# EasyEDA Pro project satelitesbol.eprj, schematic satelitesbol
Board Name: satelitesbol; Create Date: 2025-08-19; Page Name: satelitesbol; Project Name: satelitesbol; Schematic Name: satelitesbol; Update Date: 2025-08-19; File: satelitesbol; Id: /; Sheet: /
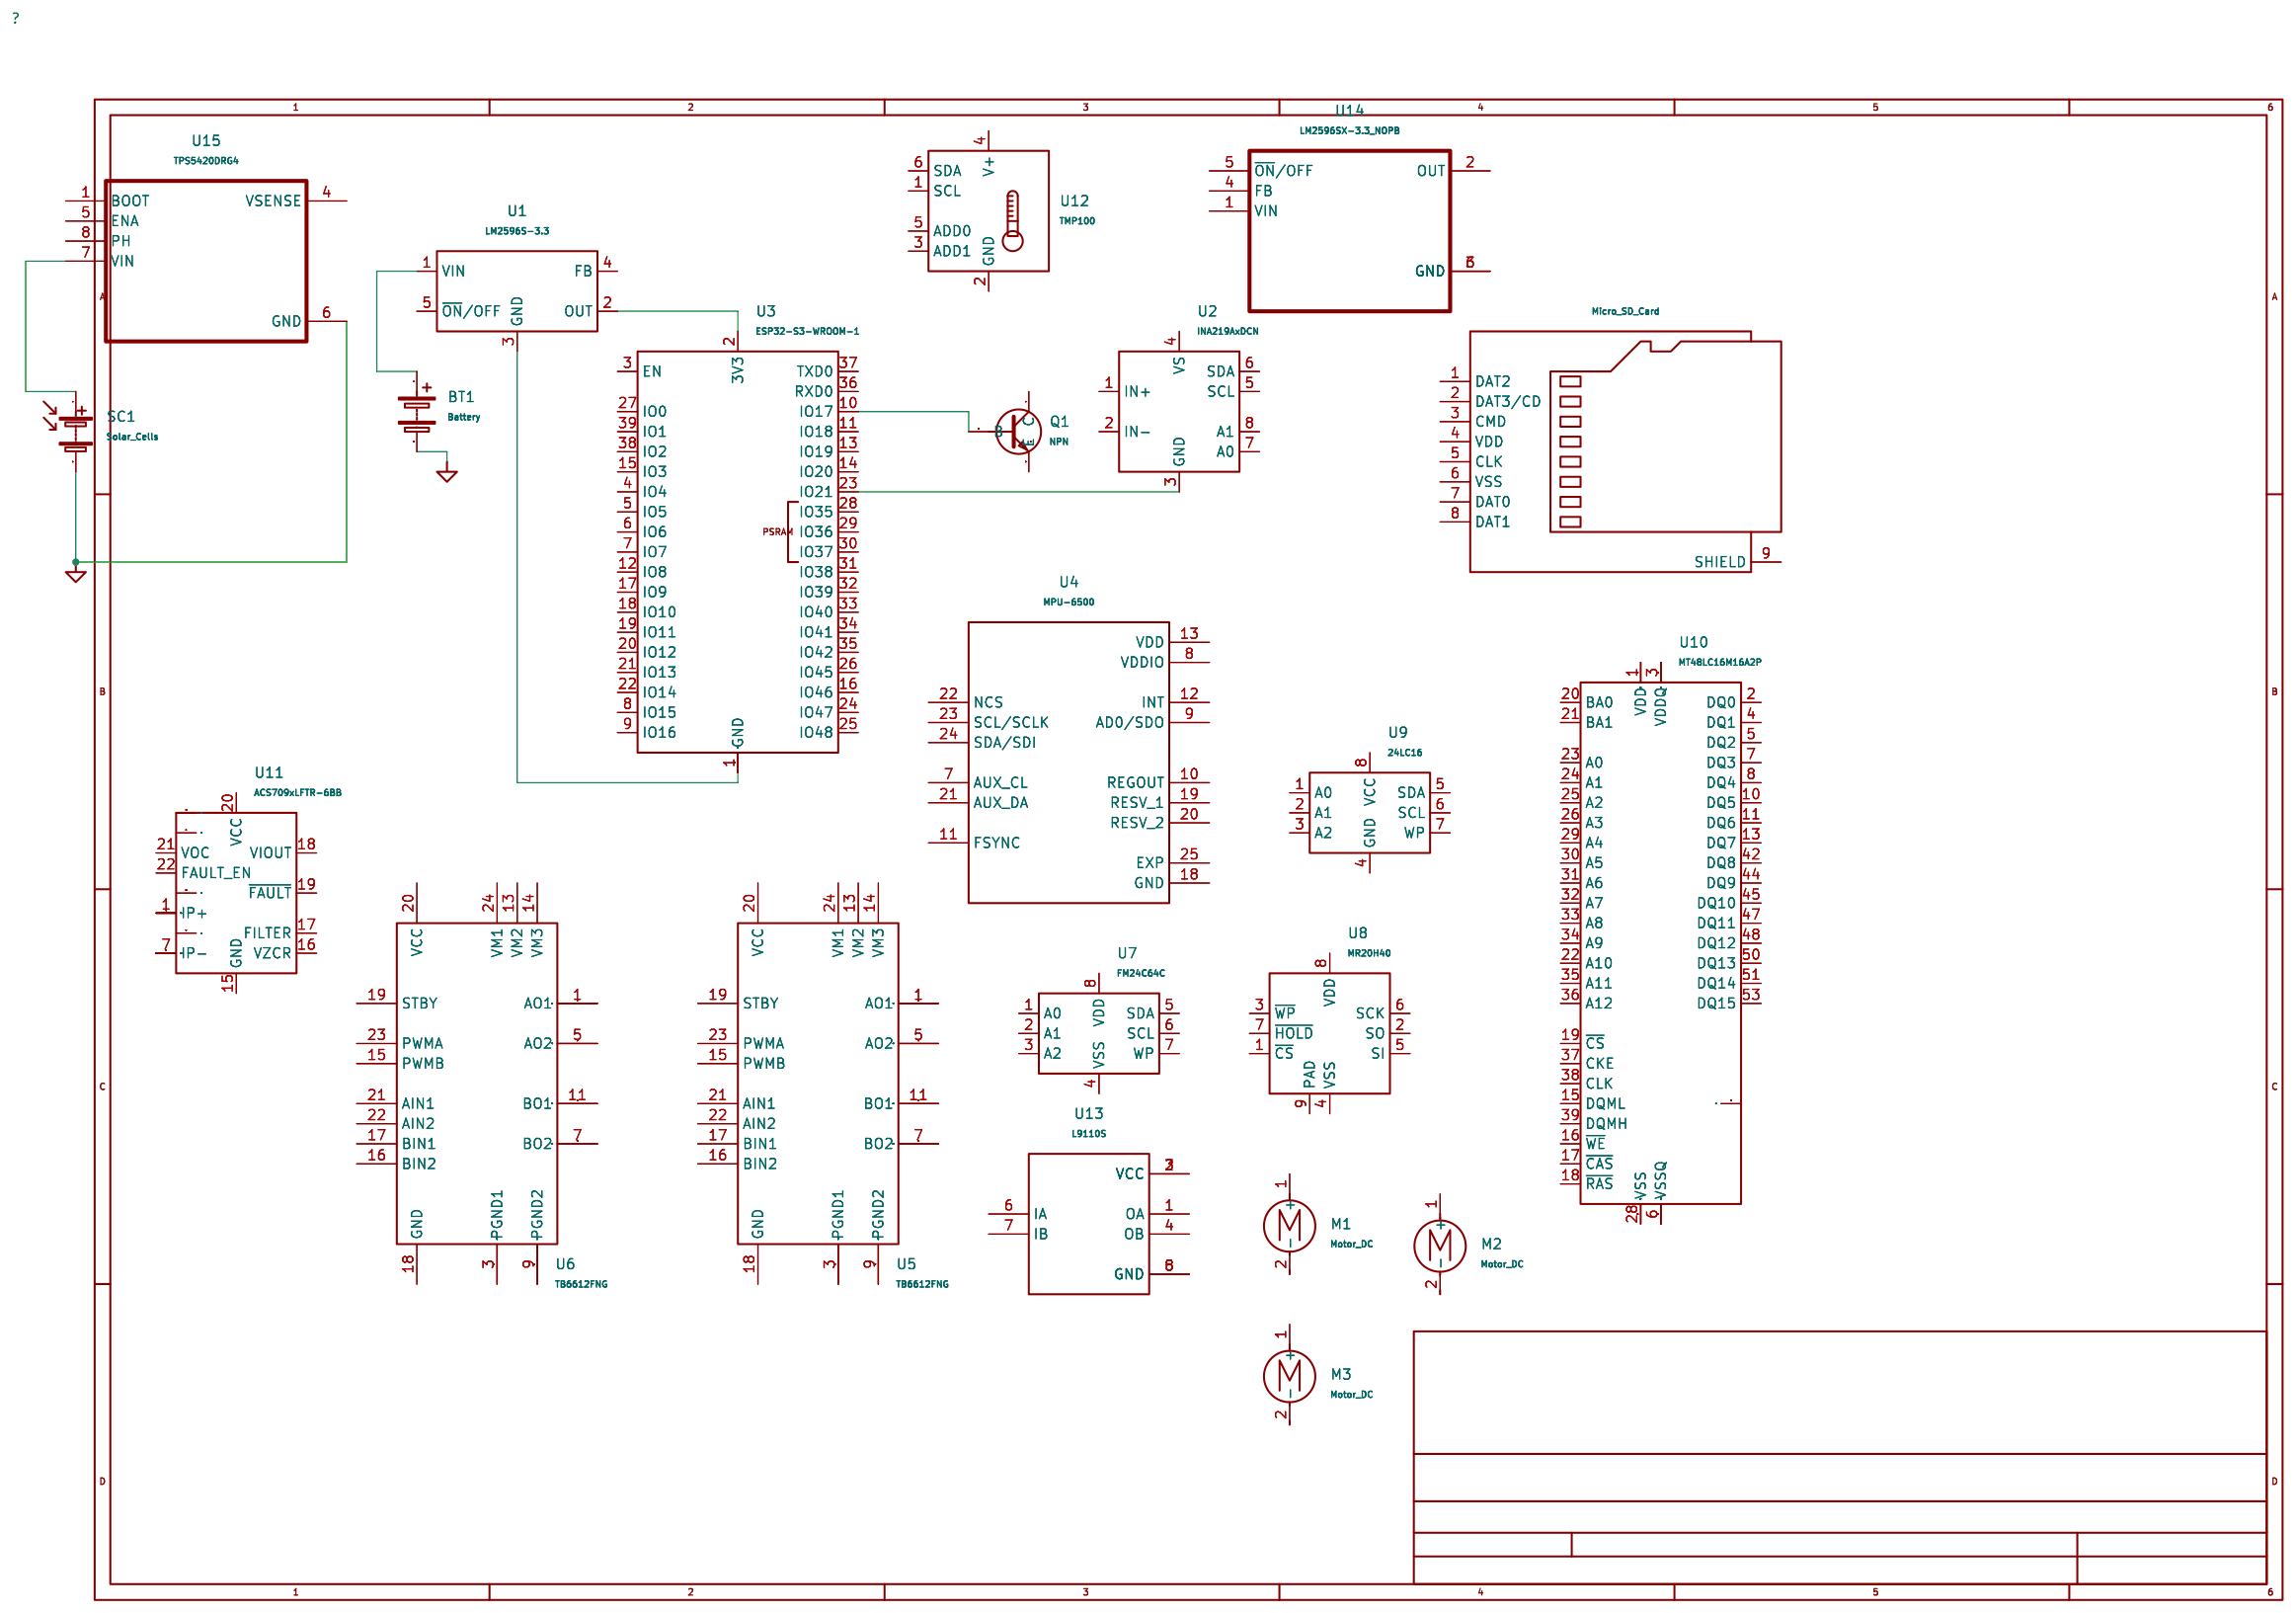
[diagram p0: schematic sheet]

## Parts
BT1  Battery
J1  Micro_SD_Card
M1  Motor_DC
M2  Motor_DC
M3  Motor_DC
Q1  NPN
SC1  Solar_Cells
U1  LM2596S-3.3
U2  INA219AxDCN
U3  ESP32-S3-WROOM-1
U4  MPU-6500
U5  TB6612FNG
U6  TB6612FNG
U7  FM24C64C
U8  MR20H40
U9  24LC16
U10  MT48LC16M16A2P
U11  ACS709xLFTR-6BB
U12  TMP100
U13  L9110S
U14  LM2596SX-3.3_NOPB
U15  TPS5420DRG4

## Library data of the parts
BT1 = Device_Battery: Multiple-cell battery
J1 = Connector_Micro_SD_Card: Micro SD Card Socket; User doc link: https://www.we-online.com/components/products/datasheet/693072010801.pdf
M1-M3 = Motor_Motor_DC: DC Motor
Q1 = Simulation_SPICE_NPN: Bipolar transistor symbol for simulation only, substrate tied to the emitter; User doc link: https://ngspice.sourceforge.io/docs/ngspice-html-manual/manual.xhtml#cha_BJTs; Sim_Type: GUMMELPOON; Sim_Pins: 1=C 2=B 3=E; Sim.Type: GUMMELPOON; Sim.Pins: 1=C 2=B 3=E
SC1 = Device_Solar_Cells: Multiple solar cells
U1 = Regulator_Switching_LM2596S-3.3: 3.3V 3A Step-Down Voltage Regulator, TO-263; User doc link: http://www.ti.com/lit/ds/symlink/lm2596.pdf
U2 = Sensor_Energy_INA219AxDCN: Zero-Drift, Bidirectional Current/Power Monitor (0-26V) With I2C Interface, SOT-23-8; User doc link: http://www.ti.com/lit/ds/symlink/ina219.pdf
U3 = RF_Module_ESP32-S3-WROOM-1: RF Module, ESP32-S3 SoC, Wi-Fi 802.11b/g/n, Bluetooth, BLE, 32-bit, 3.3V, onboard antenna, SMD; User doc link: https://www.espressif.com/sites/default/files/documentation/esp32-s3-wroom-1_wroom-1u_datasheet_en.pdf
U4 = MPU-6500_MPU-6500: B_NOM: 0.2; PIN_COUNT_D: 6.0; Check_prices: https://www.snapeda.com/parts/MPU-6500/TDK/view-part/?ref=eda; B_MAX: 0.25; Description_1: \n                        \n                            MotionTracking Device Digital Output 1.8V 24-Pin QFN EP T/R\n                        \n; Price: None; ENOM: 0.4; D_NOM: 3.0; D_MAX: 3.1; L_MAX: 0.25; Package1: QFN-24 TDK; E2_NOM: 1.54; D2_NOM: 1.7; PARTREV: 1.3; SnapEDA_Link: https://www.snapeda.com/parts/MPU-6500/TDK/view-part/?ref=snap; E_NOM: 3.0; B_MIN: 0.15; STANDARD: IPC 7351B; L_NOM: 0.3; MANUFACTURER: TDK InvenSense; MF: TDK InvenSense; MAXIMUM_PACKAGE_HEIGHT: 0.95 mm; PIN_COUNT_E: 6.0; E_MIN: 2.9; D_MIN: 2.9; L_MIN: 0.15; Availability: In Stock; E_MAX: 3.1
U5 U6 = Driver_Motor_TB6612FNG: Driver IC for Dual DC motor, SSOP-24; User doc link: https://toshiba.semicon-storage.com/us/product/linear/motordriver/detail.TB6612FNG.html
U7 = Memory_NVRAM_FM24C64C: 64Kb serial FRAM nonvolatile Memory, SOIC-8; User doc link: http://www.cypress.com/file/41651/download
U8 = Memory_NVRAM_MR20H40: 4Mb MRAM memory with SPI interface, DFN-8; User doc link: https://www.everspin.com/file/217/download
U9 = Memory_EEPROM_24LC16: I2C Serial EEPROM, 16Kb, DIP-8/SOIC-8/TSSOP-8/DFN-8; User doc link: http://ww1.microchip.com/downloads/en/DeviceDoc/21703d.pdf
U10 = Memory_RAM_MT48LC16M16A2P: 256M – (16M x 16 bit) Synchronous DRAM (SDRAM), TSOP-II-54; User doc link: https://www.micron.com/-/media/client/global/documents/products/data-sheet/dram/256mb_sdr.pdf
U11 = Sensor_Current_ACS709xLFTR-6BB: ±15A Bidirectional, Hall-Effect Current Sensor, +3.3V to +5.0V supply, 90mV/A @ +3.3V, QSOP-24; User doc link: http://www.allegromicro.com/~/media/Files/Datasheets/ACS709-Datasheet.ashx?la=en
U12 = Sensor_Temperature_TMP100: Temperature Sensor with I2C/SMBus Interface, SOT-23-6; User doc link: http://www.ti.com/lit/gpn/tmp100
U13 = L9110S_L9110S: DigiKey_Part_Number: 4518-L9110SCT-ND; SnapEDA_Link: https://www.snapeda.com/parts/L9110S/UMW/view-part/?ref=snap; MAXIMUM_PACKAGE_HEIGHT: 1.7272mm; Package1: None; Check_prices: https://www.snapeda.com/parts/L9110S/UMW/view-part/?ref=eda; STANDARD: IPC-7351B; PARTREV: NA; MF: UMW; Description_1: \n                        \n                            Bipolar Motor Driver CMOS 8-SOP\n                        \n; MANUFACTURER: UMW
U14 = LM2596SX-3.3_NOPB_LM2596SX-3.3_NOPB: MF: Texas Instruments; Description_1: \n                        \n                            SIMPLE SWITCHER- 4.5V to 40V, 3A Low Component Count Step-Down Regulator\n                        \n; Package1: TO-263-5 Texas Instruments; Price: None; SnapEDA_Link: https://www.snapeda.com/parts/LM2596SX-3.3/NOPB/Texas+Instruments/view-part/?ref=snap; MP: LM2596SX-3.3/NOPB; Availability: In Stock; Check_prices: https://www.snapeda.com/parts/LM2596SX-3.3/NOPB/Texas+Instruments/view-part/?ref=eda
U15 = TPS5420DRG4_TPS5420DRG4: MF: Texas Instruments; Description_1: \n                        \n                            5.5V to 36V Input, 2A, 500kHz Step-Down Converter 8-SOIC -40 to 125\n                        \n; Package1: SOIC-8 Texas Instruments; Price: None; SnapEDA_Link: https://www.snapeda.com/parts/TPS5420DRG4/Texas+Instruments/view-part/?ref=snap; Availability: In Stock; Check_prices: https://www.snapeda.com/parts/TPS5420DRG4/Texas+Instruments/view-part/?ref=eda

## Nets
POWER_GND: BT1.2(-) SC1.2(-) U15.6(GND)
Net-(BT1-1): BT1.1(+) U1.1(VIN)
Net-(Q1-2): Q1.2(B) U3.10(IO17)
Net-(SC1-1): SC1.1(+) U15.7(VIN)
Net-(U1-2): U1.2(OUT) U3.2(3V3)
Net-(U1-3): U1.3(GND) U3.1(GND) U3.40(GND) U3.41(GND)
Net-(U2-3): U2.3(GND) U3.23(IO21)
Net-(U5-1): U5.1(AO1) U5.2(AO1)
Net-(U5-3): U5.3(PGND1) U5.4(PGND1)
Net-(U5-5): U5.5(AO2) U5.6(AO2)
Net-(U5-7): U5.7(BO2) U5.8(BO2)
Net-(U5-9): U5.9(PGND2) U5.10(PGND2)
Net-(U5-11): U5.11(BO1) U5.12(BO1)
Net-(U6-1): U6.1(AO1) U6.2(AO1)
Net-(U6-3): U6.3(PGND1) U6.4(PGND1)
Net-(U6-5): U6.5(AO2) U6.6(AO2)
Net-(U6-7): U6.7(BO2) U6.8(BO2)
Net-(U6-9): U6.9(PGND2) U6.10(PGND2)
Net-(U6-11): U6.11(BO1) U6.12(BO1)
Net-(U10-1): U10.1(VDD) U10.14(VDD) U10.27(VDD)
Net-(U10-3): U10.3(VDDQ) U10.9(VDDQ) U10.43(VDDQ) U10.49(VDDQ)
Net-(U10-6): U10.6(VSSQ) U10.12(VSSQ) U10.46(VSSQ) U10.52(VSSQ)
Net-(U10-28): U10.28(VSS) U10.41(VSS) U10.54(VSS)
Net-(U11-1): U11.1(IP+) U11.2(IP+) U11.3(IP+) U11.4(IP+) U11.5(IP+) U11.6(IP+)
Net-(U11-7): U11.7(IP-) U11.8(IP-) U11.9(IP-) U11.10(IP-) U11.11(IP-) U11.12(IP-)
Net-(U13-2): U13.2(VCC) U13.3(VCC)
Net-(U13-5): U13.5(GND) U13.8(GND)
Net-(U14-3): U14.3(GND) U14.6(GND)

Not connected (* = marked no-connect by the designer): J1 1(DAT2) 2(DAT3/CD) 3(CMD) 4(VDD) 5(CLK) 6(VSS) 7(DAT0) 8(DAT1) 9(SHIELD); M1 1(+) 2(-); M2 1(+) 2(-); M3 1(+) 2(-); Q1 1(C) 3(E); U1 4(FB) 5(~{ON}/OFF); U2 1(IN+) 2(IN-) 4(VS) 5(SCL) 6(SDA) 7(A0) 8(A1); U3 3(EN) 4(IO4) 5(IO5) 6(IO6) 7(IO7) 8(IO15) 9(IO16) 11(IO18) 12(IO8) 13(IO19) 14(IO20) 15(IO3) 16(IO46) 17(IO9) 18(IO10) 19(IO11) 20(IO12) 21(IO13) 22(IO14) 24(IO47) 25(IO48) 26(IO45) 27(IO0) 28(IO35) 29(IO36) 30(IO37) 31(IO38) 32(IO39) 33(IO40) 34(IO41) 35(IO42) 36(RXD0) 37(TXD0) 38(IO2) 39(IO1); U4 7(AUX_CL) 8(VDDIO) 9(AD0/SDO) 10(REGOUT) 11(FSYNC) 12(INT) 13(VDD) 18(GND) 19(RESV_1) 20(RESV_2) 21(AUX_DA) 22(NCS) 23(SCL/SCLK) 24(SDA/SDI) 25(EXP); U5 13(VM2) 14(VM3) 15(PWMB) 16(BIN2) 17(BIN1) 18(GND) 19(STBY) 20(VCC) 21(AIN1) 22(AIN2) 23(PWMA) 24(VM1); U6 13(VM2) 14(VM3) 15(PWMB) 16(BIN2) 17(BIN1) 18(GND) 19(STBY) 20(VCC) 21(AIN1) 22(AIN2) 23(PWMA) 24(VM1); U7 1(A0) 2(A1) 3(A2) 4(VSS) 5(SDA) 6(SCL) 7(WP) 8(VDD); U8 1(~{CS}) 2(SO) 3(~{WP}) 4(VSS) 5(SI) 6(SCK) 7(~{HOLD}) 8(VDD) 9(PAD); U9 1(A0) 2(A1) 3(A2) 4(GND) 5(SDA) 6(SCL) 7(WP) 8(VCC); U10 2(DQ0) 4(DQ1) 5(DQ2) 7(DQ3) 8(DQ4) 10(DQ5) 11(DQ6) 13(DQ7) 15(DQML) 16(~{WE}) 17(~{CAS}) 18(~{RAS}) 19(~{CS}) 20(BA0) 21(BA1) 22(A10) 23(A0) 24(A1) 25(A2) 26(A3) 29(A4) 30(A5) 31(A6) 32(A7) 33(A8) 34(A9) 35(A11) 36(A12) 37(CKE) 38(CLK) 39(DQMH) 40(NC) 42(DQ8) 44(DQ9) 45(DQ10) 47(DQ11) 48(DQ12) 50(DQ13) 51(DQ14) 53(DQ15); U11 13(NC) 14(NC) 15(GND) 16(VZCR) 17(FILTER) 18(VIOUT) 19(~{FAULT}) 20(VCC) 21(VOC) 22(FAULT_EN) 23(NC) 24(NC); U12 1(SCL) 2(GND) 3(ADD1) 4(V+) 5(ADD0) 6(SDA); U13 1(OA) 4(OB) 6(IA) 7(IB); U14 1(VIN) 2(OUT) 4(FB) 5(~{ON}/OFF); U15 1(BOOT) 4(VSENSE) 5(ENA) 8(PH)
